# Altium schematic sheet SDR_FrontEnd.SchDoc
size B; SheetNumber: 1; SheetTotal: 4
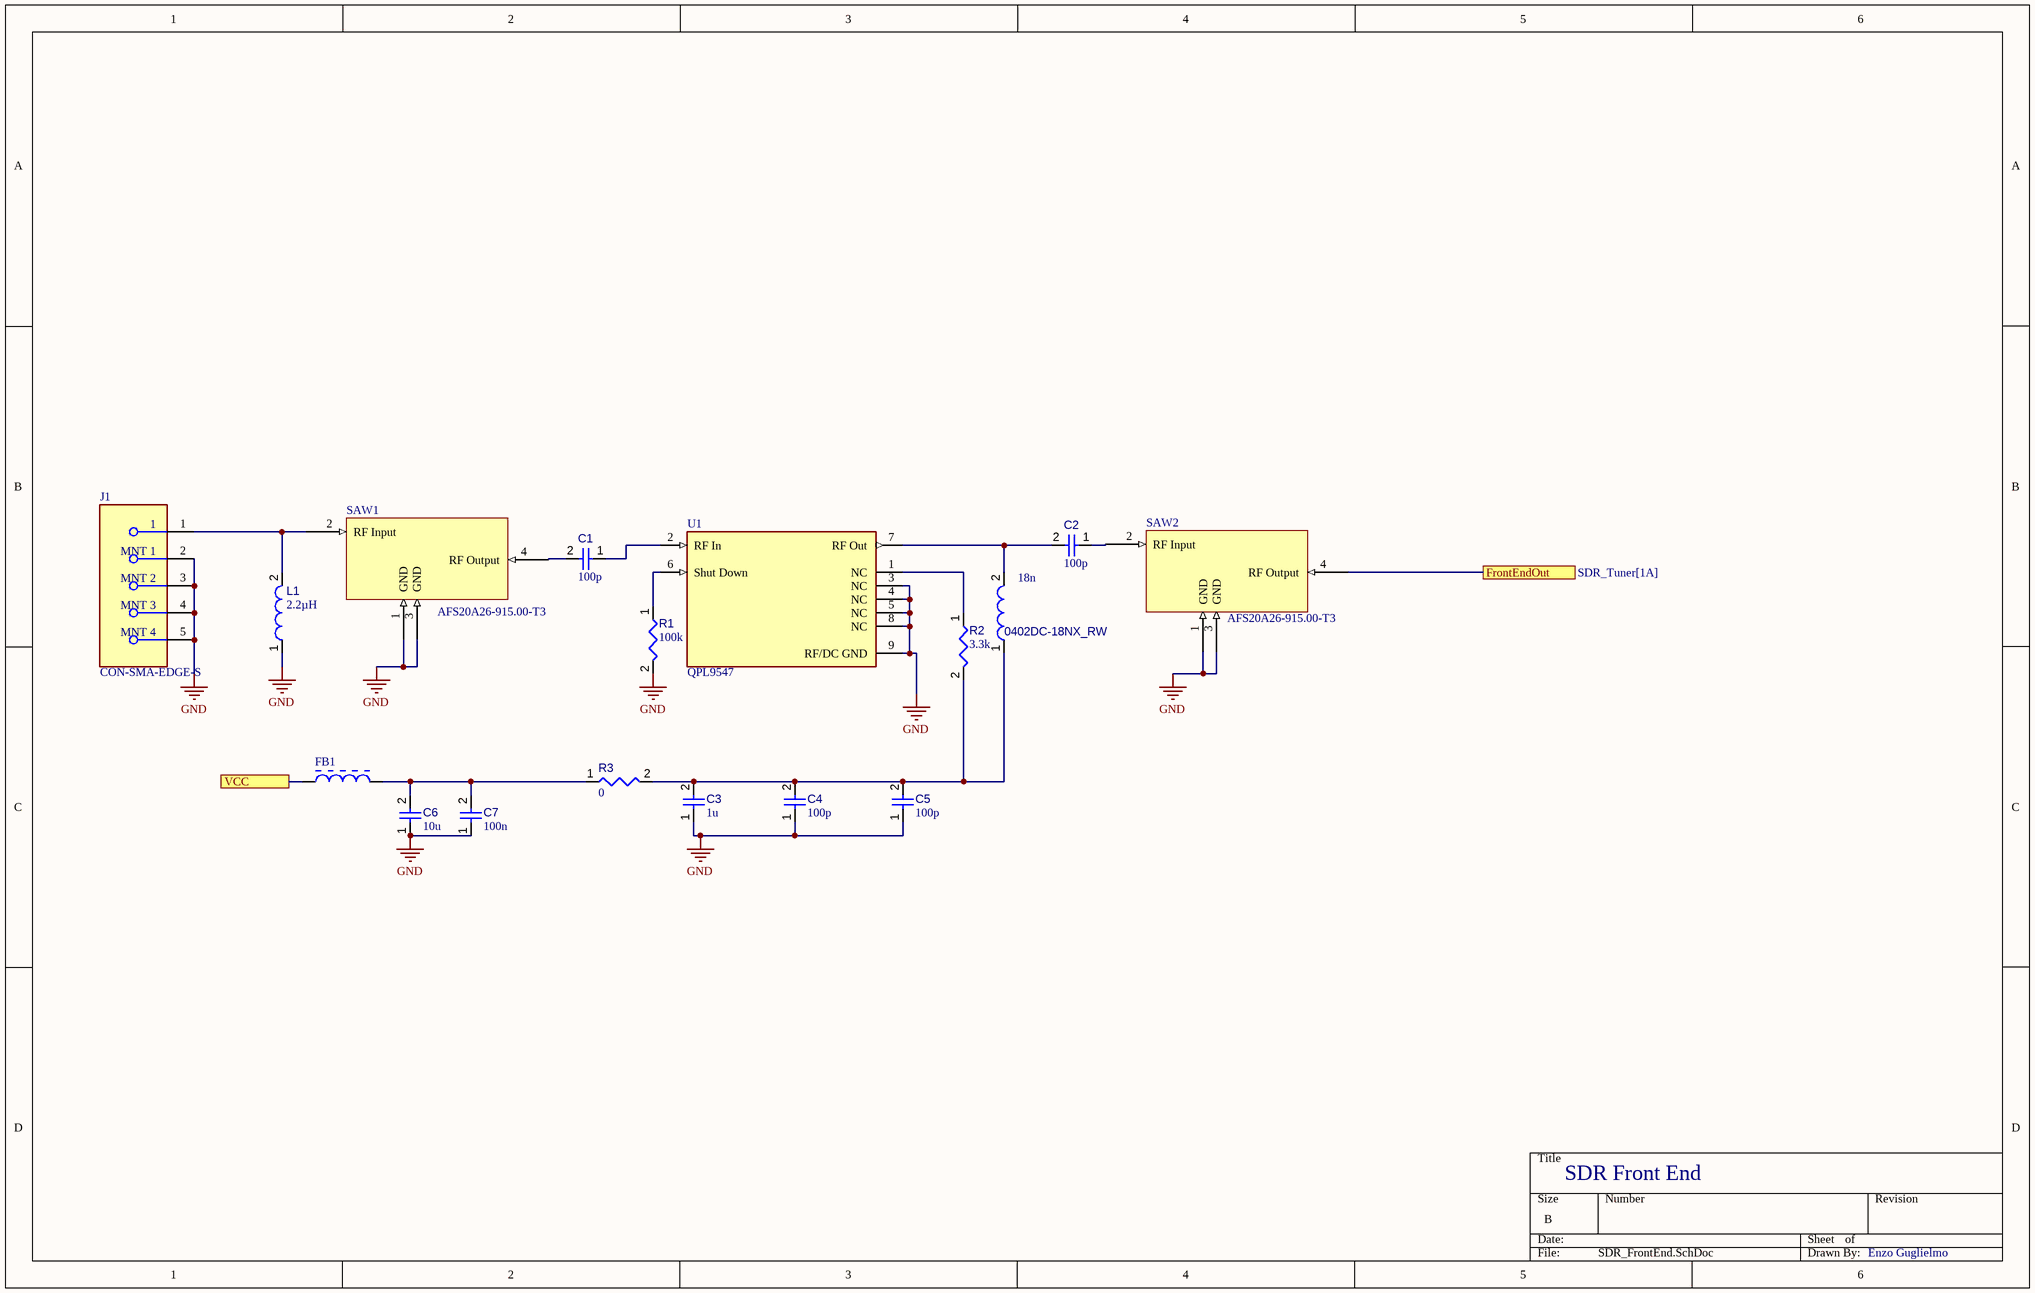
[diagram p0: SDR_FrontEnd.SchDoc]

## Parts
0402DC-18NX_RW  value 18n  [IND1005X55X20VL5T10]  (hidden comment: ELJ-RF2N2DFB)
C1  value 100p  [CAPC0402(1005)60_L]  (hidden comment: Capacitor 100nF +/-20% 25V 0402)
C2  value 100p  [CAPC0402(1005)60_L]  (hidden comment: Capacitor 100nF +/-20% 25V 0402)
C3  value 1u  [CAPC0402(1005)60_L]  (hidden comment: Capacitor 100nF +/-20% 25V 0402)
C4  value 100p  [CAPC0402(1005)60_L]  (hidden comment: Capacitor 100nF +/-20% 25V 0402)
C5  value 100p  [CAPC0402(1005)60_L]  (hidden comment: Capacitor 100nF +/-20% 25V 0402)
C6  value 10u  [CAPC0402(1005)60_L]  (hidden comment: Capacitor 100nF +/-20% 25V 0402)
C7  value 100n  [CAPC0402(1005)60_L]  (hidden comment: Capacitor 100nF +/-20% 25V 0402)
FB1  BLM21PG331SN1D  [INDC2013X105X50ML20T20]  (value not drawn)
J1  CON-SMA-EDGE-S  [FP-CON-SMA-EDGE-S-MFG]
L1  value 2.2µH  [IND1005X55X20VL5T10]  (hidden comment: ELJ-RF2N2DFB)
R1  value 100k  [RESC1005X40X25ML05T05]  (hidden comment: Resistor 100k +/-1% 0402 63 mW)
R2  value 3.3k  [RESC1005X40X25ML05T05]  (hidden comment: Resistor 100k +/-1% 0402 63 mW)
R3  value 0  [RESC1005X40X25ML05T05]  (hidden comment: Resistor 100k +/-1% 0402 63 mW)
SAW1  AFS20A26-915.00-T3  [AFS20A26-915.00-T3-Footprint-1]
SAW2  AFS20A26-915.00-T3  [AFS20A26-915.00-T3-Footprint-1]
U1  QPL9547  [FP-TQP3M9037-MFG]

## Ports
FrontEndOut (see SDR_Tuner[1A]), VCC (see SDR_Power[1C], SDR_Power[1D], SDR_Power[3A], SDR_Power[3D], SDR_Power[4C], SDR_Tuner[1B])

## Nets
GND: C3.1 C4.1 C5.1 C6.1 C7.1 J1.2(MNT_1) J1.3(MNT_2) J1.4(MNT_3) J1.5(MNT_4) L1.1 R1.2 SAW1.1(GND) SAW1.3(GND) SAW2.1(GND) SAW2.3(GND) U1.3(NC) U1.4(NC) U1.5(NC) U1.8(NC) U1.9(RF/DC_GND)
FrontEndOut: SAW2.4(RF_Output) ; port FrontEndOut
VCC: FB1.1 ; port VCC
Net0402DC-18NX_RW_1: 0402DC-18NX_RW.1 C3.2 C4.2 C5.2 R2.2 R3.2
Net0402DC-18NX_RW_2: 0402DC-18NX_RW.2 C2.2 U1.7(RF_Out)
NetC1_1: C1.1 U1.2(RF_In)
NetC1_2: C1.2 SAW1.4(RF_Output)
NetC2_1: C2.1 SAW2.2(RF_Input)
NetC6_2: C6.2 C7.2 FB1.2 R3.1
NetJ1_1: J1.1 L1.2 SAW1.2(RF_Input)
NetR1_1: R1.1 U1.6(Shut_Down)
NetR2_1: R2.1 U1.1(NC)

## Notes on the sheet
- SDR Front End
- Enzo Guglielmo

## Library data of the parts
0402DC-18NX_RW L1 = CMP-006-00006-6: Chip Inductor, 2.2 nH, +/- 0.3 nH, 400 mA, -40 to 85 degC, 0402 (1005 Metric), RoHS, Tape and Reel; Manufacturer: Panasonic; Shielding: Unshielded; Current Rating: 400mA; Tolerance: 5%; Core Material: Ceramic; Q Factor: 8; Datasheet URL: http://www.bourns.com/docs/Product-Datasheets/cm322522.pdf; Case/Package: 0402; RoHS Compliant: True; Package Description: 2-Pin Surface Mount Device, Body 1 x 0.5 mm; Packaging: TapeandReel; Datasheet Version: Sep-12; Package Quantity: 10000; Package Reference: 0402; Min Operating Temperature: -20°C; Mounting Technology: SM; Max Operating Temperature: 85°C
C1-C7 = CMP-001-00065-4: Chip Capacitor, 100nF +/-20%, 25V, 0402, Thickness 0.6 mm; Tolerance: 10%; Max Operating Temperature: 85°C; Min Operating Temperature: -55°C; Pins: 2; Voltage Rating: 25V; Mounting Technology: SMT; Case/Package: 0402
FB1 = CMP-006-00000-3: IND, Chip Ferrite Bead, 330 Ohm, +/- 25%, 1.5 A, -55 to 125 degC, 0805 (2012 Metric), Tape and Reel; Manufacturer: Murata; Current Rating: 1.5A; Impedance: 330Ohm; Resistance: 90mohm; Max Operating Temperature: 125°C; Core Material: Ferrite; Case/Package: 0805; Mounting Technology: SM; Datasheet URL: http://psearch.en.murata.com/inductor/product/LQG15HS15NJ02_.pdf; Packaging: TapeandReel; Min Operating Temperature: -55°C; RoHS Compliant: True; Max Current Rating: 1.5A; Datasheet Version: Nov-11; Package Quantity: 4000; Package Reference: 0805; Package Description: 2-Pin Surface Mount Device, Body 2 x1.25 mm; Tolerance: 25%
J1 = CMP-204357-000001-1: CONN SMA JACK STR EDGE MNT; Manufacturer: RF Solutions Ltd.; Impedance: 50Ω; Conn Orientation: Right Angle; Is Female: yes; Number Of Contacts: 1; Frequency: 18GHz; Shielding: true; Category: Conn; ComponentLink2URL: https://www.rfsolutions.co.uk/downloads/1498648656DS-CON-EDGE-SMA-4.pdf; Octopart: https://octopart.com/con-sma-edge-s-rf+solutions-70967450; Package: CONN_JACK; Manufacturer Part Number: CON-SMA-EDGE-S; Height: 6.35mm; Device Class L1: Connectors; Footprint Url: https://forum.upverter.com/uploads/default/original/3X/b/e/be75b907af57498775929d6d9099689c472e0307.pdf; Contact Material: Gold; ComponentLink2Description: Datasheet; Device Class L2: RF / Coaxial Connectors; RoHS: TRUE; Device Class L3: unset; Digikey Description: CONN SMA JACK STR EDGE MNT; Lead Free: Yes; Automotive: No
R1-R3 = CMP-009-00021-5: Chip Resistor, 100 KOhm, +/- 1%, 0.063 W, -55 to 155 degC, 0402 (1005 Metric); Voltage Rating: 50V; Power: 63mW; Pins: 2; Tolerance: 1%; Max Operating Temperature: 155°C; Case/Package: 0402; Min Operating Temperature: -55°C; Mounting Technology: SM; RoHS Compliant: True
SAW1 SAW2 = CMP-00000-1: Filter Saw 915Mhz 4Smd/Tape & Reel (Tr) Rohs Compliant: Yes; Insertion Loss (dB): 3dB; Number of Circuits: 1; Impedance: 50Ω; Voltage Rating (DC): 3V; Bandwidth: 26MHz; Case/Package: SMD/SMT; Packaging: Tape & Reel (TR); Min Operating Temperature: -30°C; Number of Terminals: 4; Length: 2mm; Mounting Technology: Surface Mount; RoHS: Compliant; Termination: SMD/SMT; Max Operating Temperature: 85°C; Height: 900µm; Frequency: 915MHz; Introduction Date: 2013-01-22; Width: 1.6mm; Cutoff Frequency: 915MHz; REACH SVHC: Unaffected; China RoHS: Compliant; Lifecycle Status: Production
U1 = CMP-231850-000001-1: RF Amp Chip Single GP 2.7GHz 5.25V 8-Pin DFN EP T/R; LCSC: C5185128